# Altium schematic sheet top.SchDoc
size A3; SheetNumber: 1; SheetTotal: 1
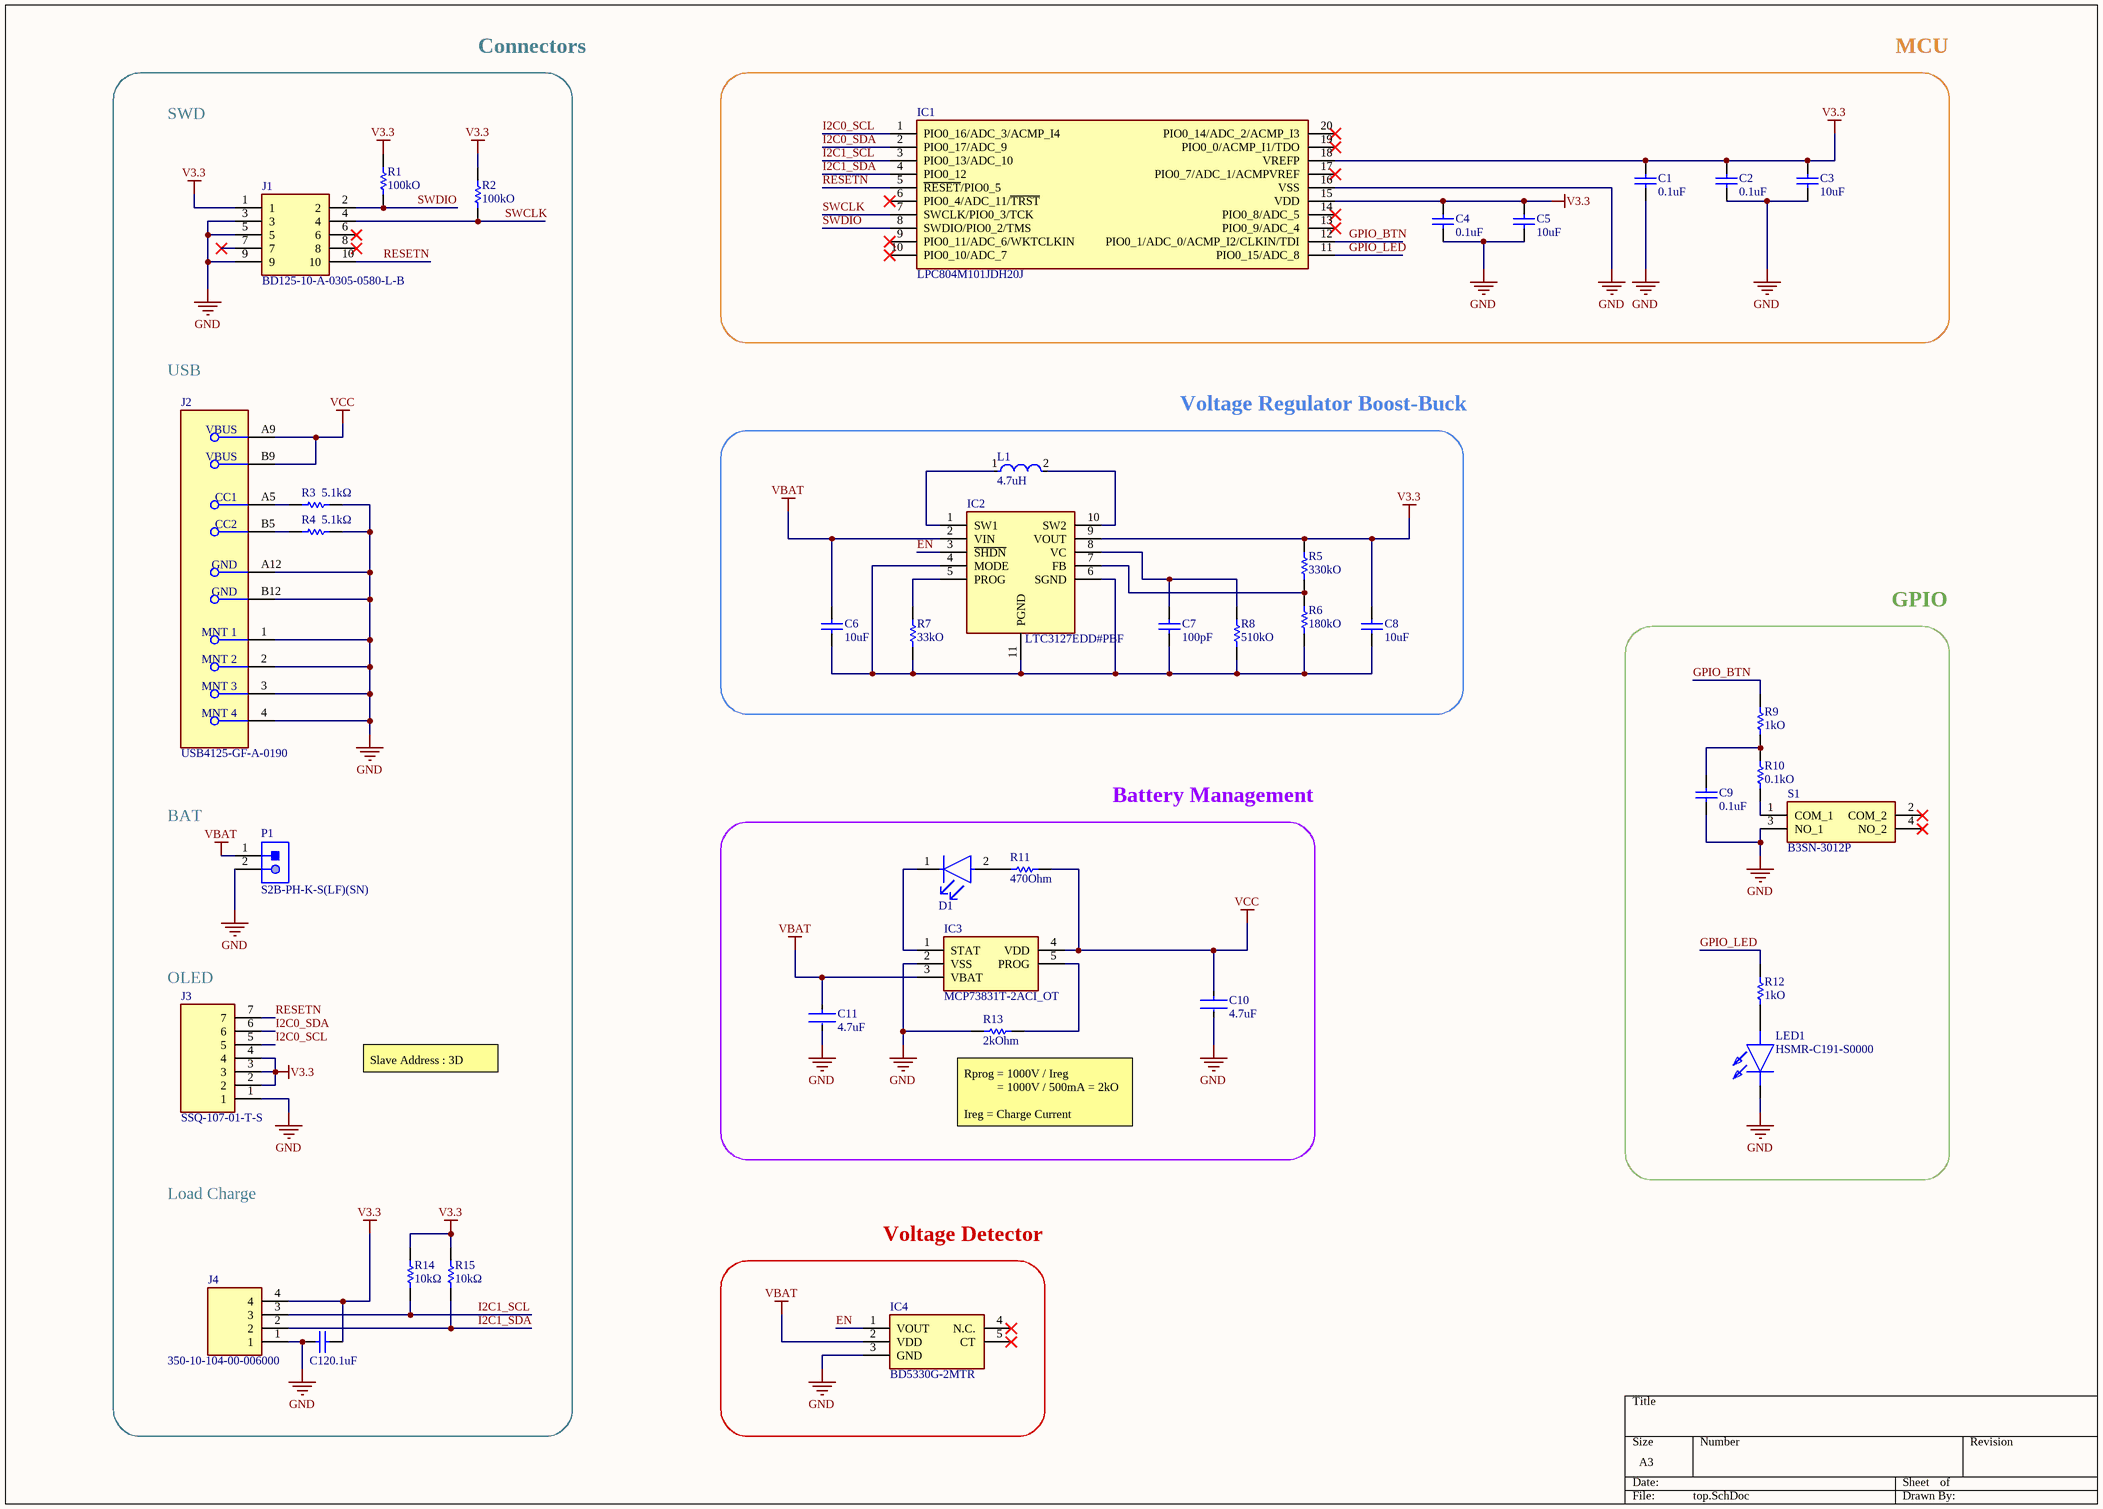
[diagram p0: top.SchDoc]

## Parts
C1  0.1uF  [CAPC1608X90X40ML10T20]
C2  0.1uF  [CAPC1608X90X40ML10T20]
C3  10uF  [CAPC1608X90X40ML10T20]
C4  0.1uF  [CAPC1608X90X40ML10T20]
C5  10uF  [CAPC1608X90X40ML10T20]
C6  10uF  [CAPC1608X90X40ML10T20]
C7  100pF  [CAPC1608X90X40ML10T20]
C8  10uF  [CAPC1608X90X40ML10T20]
C9  0.1uF  [CAPC1608X90X40ML10T20]
C10  4.7uF  [FP-CC1206-1_25-MFG]
C11  4.7uF  [FP-CC1206-1_25-MFG]
C12  0.1uF  [CAPC1608X90X40ML10T20]
D1  LTST-C190GKT  [FP-LTST-C190GKT-MFG]  (value not drawn)
IC1  LPC804M101JDH20J  [SOP65P640X110-20N]
IC2  LTC3127EDD#PBF  [SON50P300X300X80-11N-D]
IC3  MCP73831T-2ACI_OT  [SOT95P270X145-5N]
IC4  BD5330G-2MTR  [SOT95P280X125-5N]
J1  BD125-10-A-0305-0580-L-B  [BD12510A03050580LB]
J2  USB4125-GF-A-0190  [FP-USB4125-GF-A-0190-MFG]
J3  SSQ-107-01-T-S  [RHDR7W64P254_1X7_1829X241X851P]
J4  350-10-104-00-006000  [HDRV4W46P0X254_1X4_1016X254X640P]
L1  4.7uH  [FP-LQM18FN_00-IPC_A]
LED1  HSMR-C191-S0000  [LEDC1608X70N]
P1  S2B-PH-K-S(LF)(SN)  [JST-S2B-PH-K-S_V]
R1  100kO  [RESC1608X55X30LL20T10]
R2  100kO  [RESC1608X55X30LL20T10]
R3  5.1kΩ  [RESC1608X55X30LL15T15]
R4  5.1kΩ  [RESC1608X55X30LL15T15]
R5  330kO  [RESC1608X55X30LL20T10]
R6  180kO  [RESC1608X55X30LL20T10]
R7  33kO  [RESC1608X55X30LL20T10]
R8  510kO  [RESC1608X55X30LL20T10]
R9  1kO  [RESC1608X55X30LL20T10]
R10  0.1kO  [RESC1608X55X30LL20T10]
R11  470Ohm  [RESC1609X50X30ML10T20]
R12  1kO  [RESC1608X55X30LL20T10]
R13  2kOhm  [RESC1609X50X30ML10T20]
R14  10kΩ  [RESC1608X55X30LL15T15]
R15  10kΩ  [RESC1608X55X30LL15T15]
S1  B3SN-3012P  [B3SN3012P]

## Nets
GND: C1.1 C2.1 C3.1 C4.1 C5.1 C9.1 C10.2 C11.2 C12.2 IC1.16(VSS) IC3.2(VSS) IC4.3(GND) J1.3 J1.5 J1.9 J2.1(MNT_1) J2.2(MNT_2) J2.3(MNT_3) J2.4(MNT_4) J2.A12(GND) J2.B12(GND) J3.1 J4.1 LED1.1(K) P1.2 R3.2 R4.2 R13.1 S1.3(NO_1)
V3.3: C1.2 C2.2 C3.2 C4.2 C5.2 C8.2 C12.1 IC1.15(VDD) IC1.18(VREFP) IC2.9(VOUT) J1.1 J3.2 J3.3 J3.4 J4.4 R1.2 R2.2 R5.2 R14.2 R15.2
VBAT: C6.2 C11.1 IC2.2(VIN) IC3.3(VBAT) IC4.2(VDD) P1.1
VCC: C10.1 IC3.4(VDD) J2.A9(VBUS) J2.B9(VBUS) R11.2
EN: IC2.3(~{SHDN}) IC4.1(VOUT)
GPIO_BTN: IC1.12(PIO0_1/ADC_0/ACMP_I2/CLKIN/TDI) R9.2
GPIO_LED: IC1.11(PIO0_15/ADC_8) R12.2
I2C0_SCL: IC1.1(PIO0_16/ADC_3/ACMP_I4) J3.5
I2C0_SDA: IC1.2(PIO0_17/ADC_9) J3.6
I2C1_SCL: IC1.3(PIO0_13/ADC_10) J4.3 R14.1
I2C1_SDA: IC1.4(PIO0_12) J4.2 R15.1
RESETN: IC1.5(~{RESET}/PIO0_5) J1.10 J3.7
SWCLK: IC1.7(SWCLK/PIO0_3/TCK) J1.4 R2.1
SWDIO: IC1.8(SWDIO/PIO0_2/TMS) J1.2 R1.1
NetC6_1: C6.1 C7.1 C8.1 IC2.4(MODE) IC2.6(SGND) IC2.11(PGND) R6.1 R7.1 R8.1
NetC7_2: C7.2 IC2.8(VC) R8.2
NetC9_2: C9.2 R9.1 R10.2
NetD1_1: D1.1(C) IC3.1(STAT)
NetD1_2: D1.2(A) R11.1
NetIC2_1: IC2.1(SW1) L1.1
NetIC2_5: IC2.5(PROG) R7.2
NetIC2_7: IC2.7(FB) R5.1 R6.2
NetIC2_10: IC2.10(SW2) L1.2
NetIC3_5: IC3.5(PROG) R13.2
NetJ2_A5: J2.A5(CC1) R3.1
NetJ2_B5: J2.B5(CC2) R4.1
NetLED1_2: LED1.2(A) R12.1
NetR10_1: R10.1 S1.1(COM_1)

Not connected (* = marked no-connect by the designer): IC1 6(PIO0_4/ADC_11/~{TRST})* 9(PIO0_11/ADC_6/WKTCLKIN)* 10(PIO0_10/ADC_7)* 13(PIO0_9/ADC_4)* 14(PIO0_8/ADC_5)* 17(PIO0_7/ADC_1/ACMPVREF)* 19(PIO0_0/ACMP_I1/TDO)* 20(PIO0_14/ADC_2/ACMP_I3)*; IC4 4(N.C.)* 5(CT)*; J1 6* 7* 8*; S1 2(COM_2)* 4(NO_2)*

## Notes on the sheet
- Connectors
- MCU
- SWD
- USB
- Voltage Regulator Boost-Buck
- GPIO
- BAT
- Battery Management
- (near J3) OLED
- Slave Address : 3D
- (near R13) Rprog = 1000V / Ireg
  = 1000V / 500mA = 2kO
  Ireg = Charge Current
- Load Charge
- Voltage Detector

## Library data of the parts
C1-C6 C8 C9 C12 = CMP-2100-03594-1: Chip Capacitor, 100 pF, +/- 5%, 50 V, -55 to 125 degC, 0603 (1608 Metric), RoHS, Tape and Reel; Manufacturer: Yageo; Capacitance: 100pF; Voltage Rating (DC): 50V; Dielectric: C0G; Temperature Coefficient: 30ppm/degC; Insulation Resistance: 100GR; Datasheet Version: Rev. 14, 07/2016; Manufacturer URL: http://www.yageo.com/; Packaging: TapeandReel; Mount: SurfaceMount; RoHSCompliant: True; Package Reference: 0603; Tolerance: 5%; Max Operating Temperature: 125degC; Case Code (Imperial): 0603; Number of Pins: 2; Width: 0.8mm; Case Code (Metric): 1608; Voltage: 50V; REACH SVHC: Unknown; Package Description: 2-Pin Surface Mount Device, Body 1.6 x 0.8 mm; Composition: Ceramic; Lead Free: LeadFree; Min Operating Temperature: -55degC; Radiation Hardening: No; Depth: 0.8mm; Thickness: 0.035inch; Datasheet URL: http://www.yageo.com/documents/recent/UPY-GP_NP0_16V-to-50V_14.pdf; Termination: SMD/SMT; Package Quantity: 1; Length: 1.6mm; Voltage Rating: 50V; Height: 0.8mm; Case/Package: 0603
C7 = CMP-2100-03594-1: Chip Capacitor, 100 pF, +/- 5%, 50 V, -55 to 125 degC, 0603 (1608 Metric), RoHS, Tape and Reel; Manufacturer: Yageo; Voltage Rating (DC): 50V; Dielectric: C0G; Temperature Coefficient: 30ppm/degC; Insulation Resistance: 100GR; Datasheet Version: Rev. 14, 07/2016; Manufacturer URL: http://www.yageo.com/; Packaging: TapeandReel; Mount: SurfaceMount; RoHSCompliant: True; Package Reference: 0603; Tolerance: 5%; Max Operating Temperature: 125degC; Case Code (Imperial): 0603; Capacitance: 100pF; Number of Pins: 2; Width: 0.8mm; Case Code (Metric): 1608; Voltage: 50V; REACH SVHC: Unknown; Package Description: 2-Pin Surface Mount Device, Body 1.6 x 0.8 mm; Composition: Ceramic; Lead Free: LeadFree; Min Operating Temperature: -55degC; Radiation Hardening: No; Depth: 0.8mm; Thickness: 0.035inch; Datasheet URL: http://www.yageo.com/documents/recent/UPY-GP_NP0_16V-to-50V_14.pdf; Termination: SMD/SMT; Package Quantity: 1; Length: 1.6mm; Voltage Rating: 50V; Height: 0.8mm; Case/Package: 0603
C10 C11 = CMP-03422-000173-1: CAP CER 4.7UF 50V X7R 1206; Manufacturer Part Number: CC1206KKX7R9BB475; Manufacturer: Yageo; Automotive Grade: NA; Tolerance: 0.1; Temperature Coefficient: 15%; Material: Ceramic; Device Class L1: Passive Components; Category: Cap; Height: 1.45mm; Temperature Range Low: -55°C; Temperature Range High: +125°C; Package: CC1206-1.25; Lead Free: Yes; Temperature: -55°C to +125°C; RoHS: TRUE; Digikey Description: CAP CER 4.7UF 50V X7R 1206; Voltage Rating: 50 V; Device Class L2: Capacitors; Capacitance: 4.7 uF; Footprint Url: http://www.yageo.com/exep/pages/download/literatures/UPY-C_GEN_24.pdf; ComponentLink2URL: http://www.yageo.com/documents/recent/UPY-NP0X7R_HV_1KV-to-3KV_11.pdf; Temperature Characteristic: X7R; Mouser Description: CC Series 1206 4.7 uF 50 V ±10% Tolerance X7R Multilayer Ceramic Capacitor; ComponentLink2Description: Datasheet; Device Class L3: Ceramic Capacitors; Octopart: https://octopart.com/cc1206kkx7r9bb475-yageo-50417574; Value: 4.7 uF; Automotive: No
D1 = CMP-22017-000005-2: LED GREEN CLEAR CHIP SMD; Dominant Wavelength: 569nm; Reverse Voltage: 5V; Lens Color: Colorless; Viewing Angle: 130°; Voltage: 2V; Forward Current: 30mA; Power Dissipation: 100mW; Luminous Intensity: 6mcd; Number of LEDs: 1; Forward Voltage: 2.1V; Wavelength: 565nm; Test Current: 10mA; Min Operating Temperature: -55°C; Lens Style: Clear; Mount: Surface Mount; Width: 0.8mm; Packaging: Tape and Reel; Lens Transparency: Clear; Case Code (Metric): 1608; Depth: 0.8mm; Case Code (Imperial): 0603; Case/Package: 0603; Number of Pins: 2; Max Operating Temperature: 85°C; Lead Free: Lead Free; Number of Elements: 1; Length: 1.6mm; Height: 0.8mm; Package Quantity: 1; Power Rating: 100mW; Radiation Hardening: No; Illumination Color: Green; Color: Green
IC1 = LPC804M101JDH20J: Integrated Circuit; Manufacturer_Name: NXP; Datasheet Link: https://www.nxp.com/docs/en/nxp/data-sheets/LPC804_DS.pdf; Height: 1.1mm; Manufacturer_Part_Number: LPC804M101JDH20J; Mouser Part Number: 771-LPC804M101JDH20J; Mouser Price/Stock: https://www.mouser.co.uk/ProductDetail/NXP-Semiconductors/LPC804M101JDH20J?qs=W0yvOO0ixfFx8%2FU1a3Isyw%3D%3D
IC2 = LTC3127EDD#PBF: Integrated Circuit; Manufacturer_Name: Analog Devices; Datasheet Link: https://www.analog.com/media/en/technical-documentation/data-sheets/3127fa.pdf; Height: 0.8mm; Manufacturer_Part_Number: LTC3127EDD#PBF; Mouser Part Number: 584-LTC3127EDD#PBF; Mouser Price/Stock: https://www.mouser.co.uk/ProductDetail/Analog-Devices/LTC3127EDDPBF?qs=hVkxg5c3xu8G1q1ZX405dA%3D%3D; Arrow Part Number: LTC3127EDD#PBF; Arrow Price/Stock: https://www.arrow.com/en/products/ltc3127eddpbf/analog-devices
IC3 = MCP73831T-2ACI_OT: Integrated Circuit; Manufacturer_Name: Microchip; Manufacturer_Part_Number: MCP73831T-2ACI/OT; Datasheet Link: http://ww1.microchip.com/downloads/en/DeviceDoc/20001984g.pdf; Height: 1.45mm; Mouser Part Number: 579-MCP73831T-2ACIOT; Mouser Price/Stock: https://www.mouser.co.uk/ProductDetail/Microchip-Technology/MCP73831T-2ACI-OT?qs=yUQqVecv4qvbBQBGbHx0Mw%3D%3D; Arrow Part Number: MCP73831T-2ACI/OT; Arrow Price/Stock: https://www.arrow.com/en/products/mcp73831t-2aciot/microchip-technology?utm_currency=USD&region=nac
IC4 = BD5330G-2MTR: Integrated Circuit; Manufacturer_Name: ROHM Semiconductor; Datasheet Link: https://fscdn.rohm.com/en/products/databook/datasheet/ic/power/voltage_detector/bd5xxxg-2m-e.pdf; Height: 1.25mm; Manufacturer_Part_Number: BD5330G-2MTR; Mouser Part Number: 755-BD5330G-2MTR; Mouser Price/Stock: https://www.mouser.co.uk/ProductDetail/ROHM-Semiconductor/BD5330G-2MTR?qs=YCa%2FAAYMW01zqS1e%252B79Sag%3D%3D
J1 = BD125-10-A-0305-0580-L-B: Connector; Manufacturer_Name: GCT (GLOBAL CONNECTOR TECHNOLOGY); Datasheet Link: https://gct.co/connector/bd125; Height: 6.37mm; Manufacturer_Part_Number: BD125-10-A-0305-0580-L-B; Mouser Part Number: 640-BD12510A305580LB; Mouser Price/Stock: https://www.mouser.co.uk/ProductDetail/GCT/BD125-10-A-0305-0580-L-B?qs=amGC7iS6iy%252BPUE%252B5wV8wFA%3D%3D
J2 = CMP-245163-000004-1: CONN RCPT TYPE C 6P SMD RA
J3 = SSQ-107-01-T-S: Connector; Manufacturer_Name: SAMTEC; Datasheet Link: http://suddendocs.samtec.com/prints/ssq-1xx-xx-xxx-x-xx-xxx-xx-x-mkt.pdf; Height: 8.51mm; Manufacturer_Part_Number: SSQ-107-01-T-S; Mouser Part Number: 200-SSQ10701TS; Mouser Price/Stock: https://www.mouser.co.uk/ProductDetail/Samtec/SSQ-107-01-T-S?qs=rU5fayqh%252BE1xq4UrLxRC5Q%3D%3D
J4 = 350-10-104-00-006000: Connector; Manufacturer_Name: Mill-Max; Datasheet Link: https://www.mouser.com/datasheet/2/273/MMMCS22968_1-2552356.pdf; Height: 6.401mm; Manufacturer_Part_Number: 350-10-104-00-006000
L1 = CMP-06042-016387-1: FIXED IND 4.7UH 80MA 600 MOHM; Self Resonant Frequency: 50MHz; Core Material: Ferrite; DC Resistance (DCR): 600mR; Test Frequency: 1MHz; Shielding: Shielded; Tolerance: 20%; Max DC Current: 80mA; Width: 0.031inch; Inductance: 4.7uH; RoHS Compliant: Yes; Packaging: Tape and Reel; Case Code (Metric): 1608; Weight: 7.1E-05oz; Lead Free: Lead Free; DC Current: 80mA; Height - Seated (Max): 0.035inch; Rated Current-Max: 80mA; Max Operating Temperature: 125°C; Height: 0.8mm; Radiation Hardening: No; Current Rating: 80mA; Package Quantity: 4000; Case Code (Imperial): 0603; Case/Package: 0603; Termination: SMD/SMT; Min Operating Temperature: -55°C; Mount: Surface Mount; Series: LQM18F; Saturation Current: 80mA; Depth: 0.9mm; Military Standard: Not; Length: 1.6mm
LED1 = HSMR-C191-S0000: LED; Manufacturer_Name: Avago Technologies; Datasheet Link: https://docs.broadcom.com/docs/HSMR-C191-S0000-DS100; Height: 0.7mm; Manufacturer_Part_Number: HSMR-C191-S0000; Mouser Part Number: 630-HSMR-C191-S0000; Mouser Price/Stock: https://www.mouser.co.uk/ProductDetail/Broadcom-Avago/HSMR-C191-S0000?qs=tMOYG%252Bw4%252BLxppTo9IXYduQ%3D%3D
P1 = CMP-1755-00004-1: Male Header, Pitch 2 mm, 1 x 2 Position, Height 4.8 mm, Tail Length 3.4 mm, -25 to 85 degC, RoHS, Bulk; Case\Package: Radial; Tolerance: 20%; Capacitance: 10 uF; Voltage Rating (DC): 50 V; Packaging: Bulk; ComponentLink1URL: http://www.jst-mfg.com/product/pdf/eng/ePH.pdf; Radiation Hardening: No; Height: 11 mm; Package Quantity: 200; PackageDescription: Male Header, Pitch 2 mm, 1 x 2 Position, Height 4.8 mm, Tail Length 3.4 mm; PackageReference: S2B-PH-K-S; Diameter: 5 mm; Pins: 2; Mount: Through Hole; Max Operating Temperature: 85 degC; Min Operating Temperature: -40 degC; ComponentLink1Description: Datasheet; DatasheetVersion: Dec-12; Length: 11 mm; Lead Pitch: 2 mm; REACH SVHC: No SVHC; Voltage Rating: 50 V; RoHSCompliant: true
R1 R2 R5-R10 R12 = CMP-2000-01250-1: Manufacturer: KOA Speer; Part Number: RK73H1JTTD1823F
R3 R4 R14 R15 = CMP-2000-00803-1: Part Number: ERJ-3GEYJ512V; Manufacturer: Panasonic
R11 R13 = CMP-2000-03159-1: Manufacturer: Vishay Dale; Part Number: CRCW06032K00FKEA
S1 = B3SN-3012P: Switch; Manufacturer_Name: Omron Electronics; Datasheet Link: https://componentsearchengine.com/Datasheets/2/B3SN-3012P.pdf; Height: 3.4mm; Manufacturer_Part_Number: B3SN-3012P; Mouser Part Number: 653-B3SN-3012P; Mouser Price/Stock: https://www.mouser.co.uk/ProductDetail/Omron-Electronics/B3SN-3012P?qs=nNiD76Ca0%252BuGaCx%252BnRL5KQ%3D%3D; Arrow Part Number: B3SN-3012P; Arrow Price/Stock: https://www.arrow.com/en/products/b3sn3012p/omron?region=nac